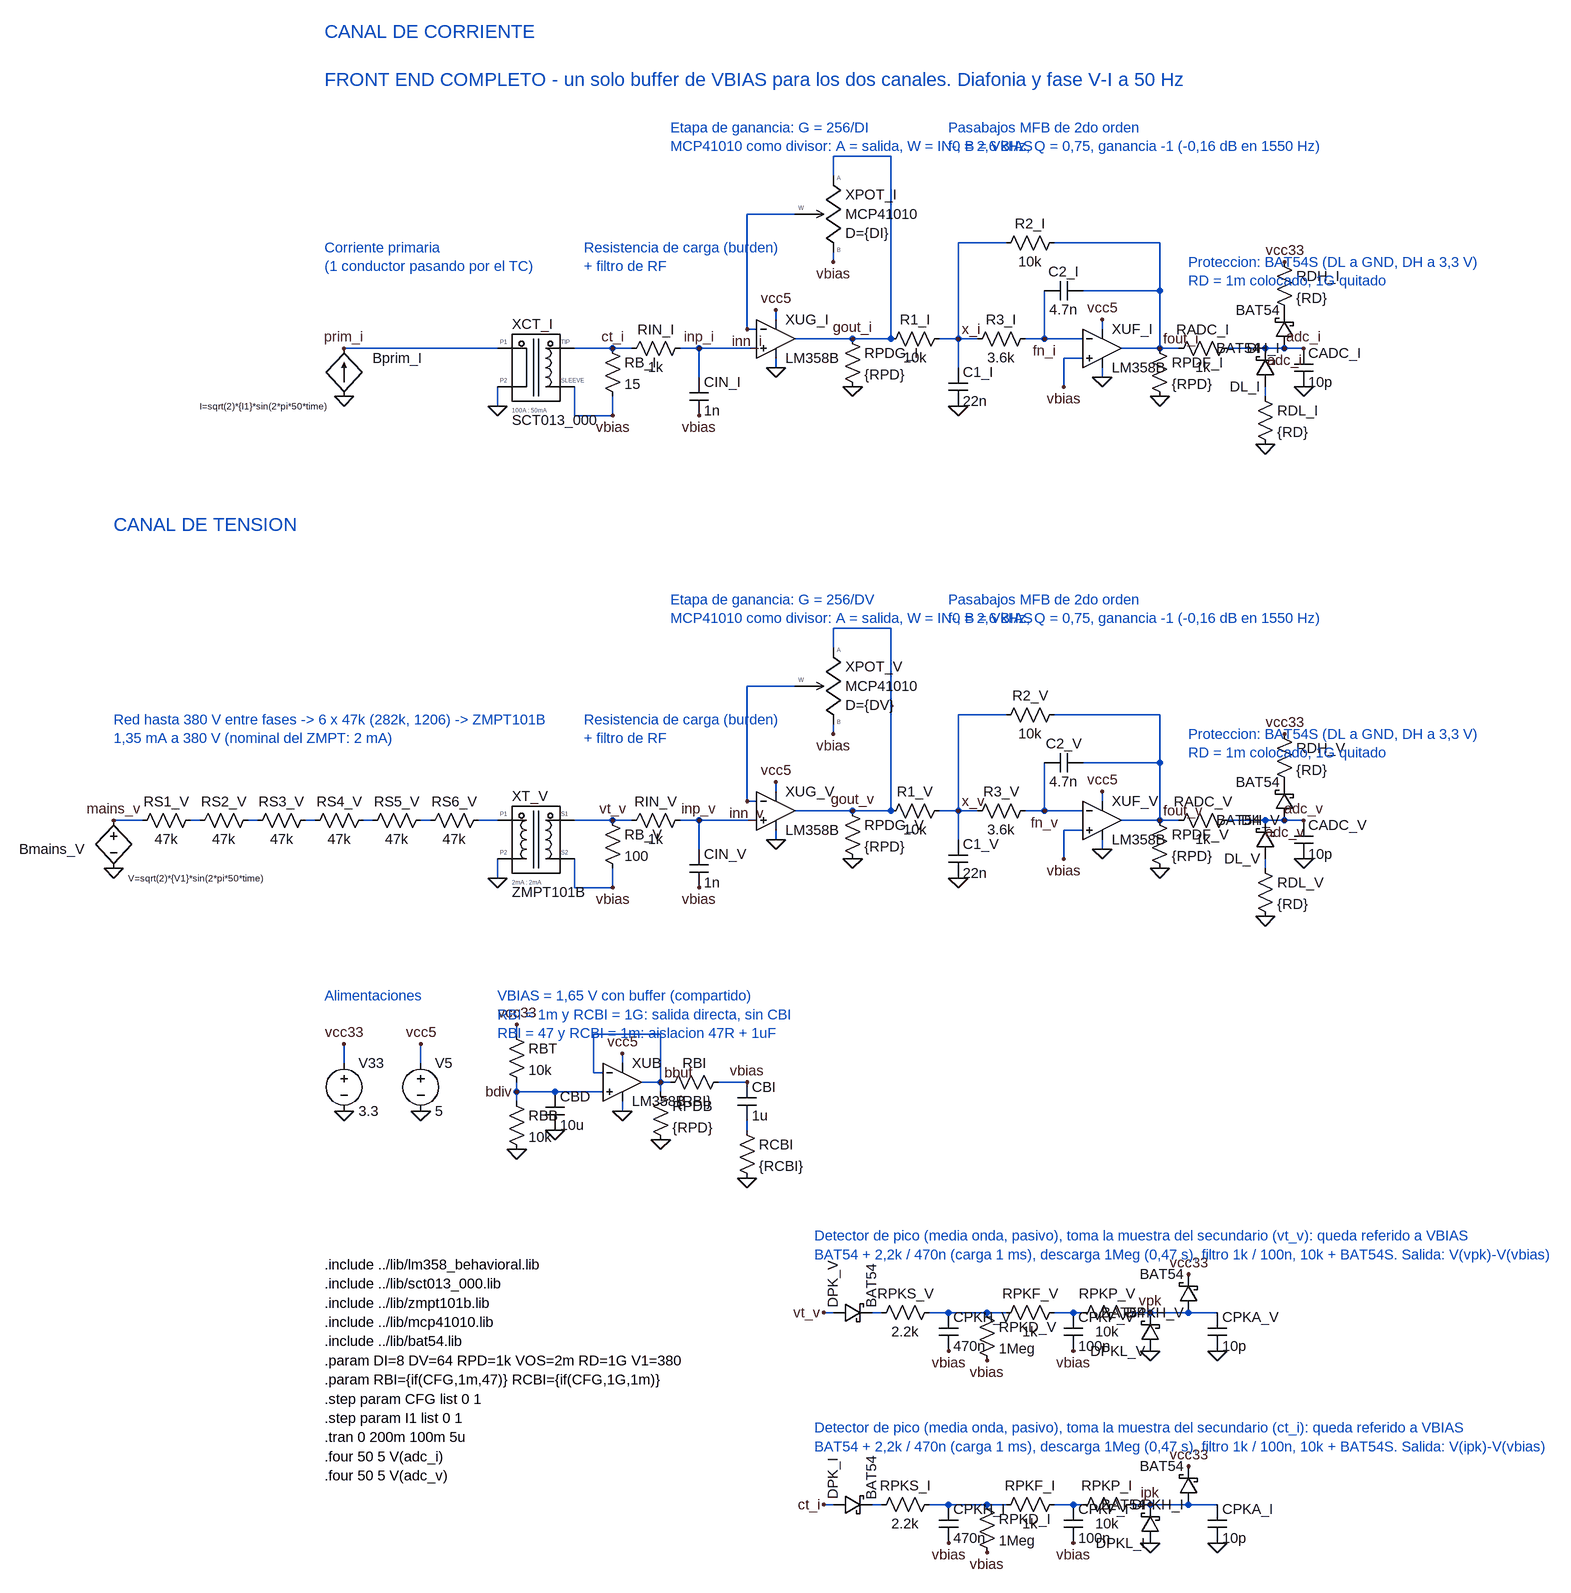
[diagram p0: schematic front_end_tran.asc]
front_end_tran.asc, the LTspice schematic file:
Version 4
SHEET 1 1880 1100
WIRE -960 128 -704 128
WIRE -704 192 -704 224
WIRE -576 128 -512 128
WIRE -576 192 -576 240
WIRE -576 240 -512 240
WIRE -512 240 -512 208
WIRE -512 128 -480 128
WIRE -400 128 -368 128
WIRE -368 128 -368 176
WIRE -368 128 -272 128
WIRE -240 80 -240 64
WIRE -240 144 -240 160
WIRE -208 -96 -288 -96
WIRE -288 -96 -288 96
WIRE -288 96 -272 96
WIRE -144 -32 -144 -16
WIRE -208 112 -112 112
WIRE -112 112 -48 112
WIRE -144 -160 -144 -192
WIRE -144 -192 -48 -192
WIRE -48 -192 -48 112
WIRE 32 112 64 112
WIRE 64 112 64 160
WIRE 64 112 96 112
WIRE 64 112 64 -48
WIRE 64 -48 144 -48
WIRE 176 112 208 112
WIRE 208 112 272 112
WIRE 208 112 208 32
WIRE 272 32 400 32
WIRE 224 -48 400 -48
WIRE 400 -48 400 32
WIRE 400 32 400 128
WIRE 336 128 400 128
WIRE 272 144 240 144
WIRE 240 144 240 192
WIRE 304 96 304 80
WIRE 304 160 304 176
WIRE 400 128 432 128
WIRE 512 128 576 128
WIRE 576 128 640 128
WIRE 576 192 576 208
WIRE -1344 1248 -1296 1248
WIRE -1216 1248 -1200 1248
WIRE -1120 1248 -1104 1248
WIRE -1024 1248 -1008 1248
WIRE -928 1248 -912 1248
WIRE -832 1248 -816 1248
WIRE -736 1248 -704 1248
WIRE -704 1312 -704 1344
WIRE -576 1248 -512 1248
WIRE -576 1312 -576 1360
WIRE -576 1360 -512 1360
WIRE -512 1360 -512 1328
WIRE -512 1248 -480 1248
WIRE -400 1248 -368 1248
WIRE -368 1248 -368 1296
WIRE -368 1248 -272 1248
WIRE -240 1200 -240 1184
WIRE -240 1264 -240 1280
WIRE -208 1024 -288 1024
WIRE -288 1024 -288 1216
WIRE -288 1216 -272 1216
WIRE -144 1088 -144 1104
WIRE -208 1232 -112 1232
WIRE -112 1232 -48 1232
WIRE -144 960 -144 928
WIRE -144 928 -48 928
WIRE -48 928 -48 1232
WIRE 32 1232 64 1232
WIRE 64 1232 64 1280
WIRE 64 1232 96 1232
WIRE 64 1232 64 1072
WIRE 64 1072 144 1072
WIRE 176 1232 208 1232
WIRE 208 1232 272 1232
WIRE 208 1232 208 1152
WIRE 272 1152 400 1152
WIRE 224 1072 400 1072
WIRE 400 1072 400 1152
WIRE 400 1152 400 1248
WIRE 336 1248 400 1248
WIRE 272 1264 240 1264
WIRE 240 1264 240 1312
WIRE 304 1216 304 1200
WIRE 304 1280 304 1296
WIRE 400 1248 432 1248
WIRE 512 1248 576 1248
WIRE 576 1248 640 1248
WIRE 576 1312 576 1328
WIRE -960 2064 -960 2032
WIRE -832 2064 -832 2032
WIRE -672 2016 -672 2000
WIRE -672 2096 -672 2112
WIRE -672 2112 -672 2128
WIRE -672 2112 -608 2112
WIRE -608 2112 -528 2112
WIRE -496 2064 -496 2048
WIRE -496 2128 -496 2144
WIRE -464 2096 -432 2096
WIRE -432 2096 -432 2016
WIRE -432 2016 -544 2016
WIRE -544 2016 -544 2080
WIRE -544 2080 -528 2080
WIRE -432 2096 -432 2112
WIRE -432 2096 -416 2096
WIRE -336 2096 -288 2096
WIRE -288 2160 -288 2176
WIRE -160 2480 -144 2480
WIRE -80 2480 -64 2480
WIRE 16 2480 48 2480
WIRE 48 2480 112 2480
WIRE 112 2480 144 2480
WIRE 224 2480 256 2480
WIRE 256 2480 272 2480
WIRE 352 2480 448 2480
WIRE 448 2480 496 2480
WIRE -160 2800 -144 2800
WIRE -80 2800 -64 2800
WIRE 16 2800 48 2800
WIRE 48 2800 112 2800
WIRE 112 2800 144 2800
WIRE 224 2800 256 2800
WIRE 256 2800 272 2800
WIRE 352 2800 448 2800
WIRE 448 2800 496 2800
FLAG -960 208 0
FLAG -960 128 prim_i
FLAG -704 224 0
FLAG -512 240 vbias
FLAG -512 128 ct_i
FLAG -368 240 vbias
FLAG -368 128 inp_i
FLAG -240 64 vcc5
FLAG -240 160 0
FLAG -288 96 inn_i
FLAG -144 -16 vbias
FLAG -112 192 0
FLAG -112 112 gout_i
FLAG 64 224 0
FLAG 64 112 x_i
FLAG 208 112 fn_i
FLAG 240 192 vbias
FLAG 304 80 vcc5
FLAG 304 176 0
FLAG 400 208 0
FLAG 400 128 fout_i
FLAG 576 288 0
FLAG 640 192 0
FLAG 640 128 adc_i
FLAG -1344 1328 0
FLAG -1344 1248 mains_v
FLAG -704 1344 0
FLAG -512 1360 vbias
FLAG -512 1248 vt_v
FLAG -368 1360 vbias
FLAG -368 1248 inp_v
FLAG -240 1184 vcc5
FLAG -240 1280 0
FLAG -288 1216 inn_v
FLAG -144 1104 vbias
FLAG -112 1312 0
FLAG -112 1232 gout_v
FLAG 64 1344 0
FLAG 64 1232 x_v
FLAG 208 1232 fn_v
FLAG 240 1312 vbias
FLAG 304 1200 vcc5
FLAG 304 1296 0
FLAG 400 1328 0
FLAG 400 1248 fout_v
FLAG 576 1408 0
FLAG 640 1312 0
FLAG 640 1248 adc_v
FLAG -960 2032 vcc33
FLAG -960 2144 0
FLAG -832 2032 vcc5
FLAG -832 2144 0
FLAG -672 2000 vcc33
FLAG -672 2208 0
FLAG -608 2176 0
FLAG -672 2112 bdiv
FLAG -496 2048 vcc5
FLAG -496 2144 0
FLAG -432 2192 0
FLAG -432 2096 bbuf
FLAG -288 2256 0
FLAG -288 2096 vbias
FLAG 608 128 adc_i
FLAG 608 -16 vcc33
FLAG 608 1248 adc_v
FLAG 608 1104 vcc33
FLAG -160 2480 vt_v
FLAG 48 2544 vbias
FLAG 112 2560 vbias
FLAG 256 2544 vbias
FLAG 384 2480 vpk
FLAG 384 2544 0
FLAG 448 2416 vcc33
FLAG 496 2544 0
FLAG -160 2800 ct_i
FLAG 48 2864 vbias
FLAG 112 2880 vbias
FLAG 256 2864 vbias
FLAG 384 2800 ipk
FLAG 384 2864 0
FLAG 448 2736 vcc33
FLAG 496 2864 0
SYMBOL bi -960 208 R180
WINDOW 0 -48 64 Right 2
WINDOW 3 24 -16 Left 1
SYMATTR InstName Bprim_I
SYMATTR Value I=sqrt(2)*{I1}*sin(2*pi*50*time)
SYMBOL SCT013_000 -640 128 R0
SYMATTR InstName XCT_I
SYMATTR Value SCT013_000
SYMBOL res -528 112 R0
SYMATTR InstName RB_I
SYMATTR Value 15
SYMBOL res -384 112 R90
WINDOW 0 0 56 VBottom 2
WINDOW 3 32 56 VTop 2
SYMATTR InstName RIN_I
SYMATTR Value 1k
SYMBOL cap -384 176 R0
SYMATTR InstName CIN_I
SYMATTR Value 1n
SYMBOL OpAmps\\opamp2 -240 48 R0
SYMATTR InstName XUG_I
SYMATTR Value LM358B
SYMATTR SpiceLine VOS={VOS}
SYMBOL MCP41010 -144 -160 R0
SYMATTR InstName XPOT_I
SYMATTR Value MCP41010
SYMATTR SpiceLine D={DI}
SYMBOL res -128 96 R0
SYMATTR InstName RPDG_I
SYMATTR Value {RPD}
SYMBOL res 48 96 R90
WINDOW 0 0 56 VBottom 2
WINDOW 3 32 56 VTop 2
SYMATTR InstName R1_I
SYMATTR Value 10k
SYMBOL cap 48 160 R0
SYMATTR InstName C1_I
SYMATTR Value 22n
SYMBOL res 192 96 R90
WINDOW 0 0 56 VBottom 2
WINDOW 3 32 56 VTop 2
SYMATTR InstName R3_I
SYMATTR Value 3.6k
SYMBOL res 240 -64 R90
WINDOW 0 0 56 VBottom 2
WINDOW 3 32 56 VTop 2
SYMATTR InstName R2_I
SYMATTR Value 10k
SYMBOL OpAmps\\opamp2 304 64 R0
SYMATTR InstName XUF_I
SYMATTR Value LM358B
SYMBOL cap 272 16 R90
WINDOW 0 0 32 VBottom 2
WINDOW 3 32 32 VTop 2
SYMATTR InstName C2_I
SYMATTR Value 4.7n
SYMBOL res 384 112 R0
SYMATTR InstName RPDF_I
SYMATTR Value {RPD}
SYMBOL res 528 112 R90
WINDOW 0 0 56 VBottom 2
WINDOW 3 32 56 VTop 2
SYMATTR InstName RADC_I
SYMATTR Value 1k
SYMBOL schottky 592 192 R180
SYMATTR InstName DL_I
SYMATTR Value BAT54
SYMBOL res 560 192 R0
SYMATTR InstName RDL_I
SYMATTR Value {RD}
SYMBOL cap 624 128 R0
SYMATTR InstName CADC_I
SYMATTR Value 10p
SYMBOL bv -1344 1232 R0
WINDOW 0 -48 64 Right 2
WINDOW 3 24 112 Left 1
SYMATTR InstName Bmains_V
SYMATTR Value V=sqrt(2)*{V1}*sin(2*pi*50*time)
SYMBOL res -1200 1232 R90
WINDOW 0 0 56 VBottom 2
WINDOW 3 32 56 VTop 2
SYMATTR InstName RS1_V
SYMATTR Value 47k
SYMBOL res -1104 1232 R90
WINDOW 0 0 56 VBottom 2
WINDOW 3 32 56 VTop 2
SYMATTR InstName RS2_V
SYMATTR Value 47k
SYMBOL res -1008 1232 R90
WINDOW 0 0 56 VBottom 2
WINDOW 3 32 56 VTop 2
SYMATTR InstName RS3_V
SYMATTR Value 47k
SYMBOL res -912 1232 R90
WINDOW 0 0 56 VBottom 2
WINDOW 3 32 56 VTop 2
SYMATTR InstName RS4_V
SYMATTR Value 47k
SYMBOL res -816 1232 R90
WINDOW 0 0 56 VBottom 2
WINDOW 3 32 56 VTop 2
SYMATTR InstName RS5_V
SYMATTR Value 47k
SYMBOL res -720 1232 R90
WINDOW 0 0 56 VBottom 2
WINDOW 3 32 56 VTop 2
SYMATTR InstName RS6_V
SYMATTR Value 47k
SYMBOL ZMPT101B -640 1248 R0
SYMATTR InstName XT_V
SYMATTR Value ZMPT101B
SYMBOL res -528 1232 R0
SYMATTR InstName RB_V
SYMATTR Value 100
SYMBOL res -384 1232 R90
WINDOW 0 0 56 VBottom 2
WINDOW 3 32 56 VTop 2
SYMATTR InstName RIN_V
SYMATTR Value 1k
SYMBOL cap -384 1296 R0
SYMATTR InstName CIN_V
SYMATTR Value 1n
SYMBOL OpAmps\\opamp2 -240 1168 R0
SYMATTR InstName XUG_V
SYMATTR Value LM358B
SYMATTR SpiceLine VOS={VOS}
SYMBOL res -128 1216 R0
SYMATTR InstName RPDG_V
SYMATTR Value {RPD}
SYMBOL res 48 1216 R90
WINDOW 0 0 56 VBottom 2
WINDOW 3 32 56 VTop 2
SYMATTR InstName R1_V
SYMATTR Value 10k
SYMBOL cap 48 1280 R0
SYMATTR InstName C1_V
SYMATTR Value 22n
SYMBOL res 192 1216 R90
WINDOW 0 0 56 VBottom 2
WINDOW 3 32 56 VTop 2
SYMATTR InstName R3_V
SYMATTR Value 3.6k
SYMBOL res 240 1056 R90
WINDOW 0 0 56 VBottom 2
WINDOW 3 32 56 VTop 2
SYMATTR InstName R2_V
SYMATTR Value 10k
SYMBOL OpAmps\\opamp2 304 1184 R0
SYMATTR InstName XUF_V
SYMATTR Value LM358B
SYMBOL cap 272 1136 R90
WINDOW 0 0 32 VBottom 2
WINDOW 3 32 32 VTop 2
SYMATTR InstName C2_V
SYMATTR Value 4.7n
SYMBOL res 384 1232 R0
SYMATTR InstName RPDF_V
SYMATTR Value {RPD}
SYMBOL res 528 1232 R90
WINDOW 0 0 56 VBottom 2
WINDOW 3 32 56 VTop 2
SYMATTR InstName RADC_V
SYMATTR Value 1k
SYMBOL schottky 592 1312 R180
SYMATTR InstName DL_V
SYMATTR Value BAT54
SYMBOL res 560 1312 R0
SYMATTR InstName RDL_V
SYMATTR Value {RD}
SYMBOL cap 624 1248 R0
SYMATTR InstName CADC_V
SYMATTR Value 10p
SYMBOL voltage -960 2048 R0
SYMATTR InstName V33
SYMATTR Value 3.3
SYMBOL voltage -832 2048 R0
SYMATTR InstName V5
SYMATTR Value 5
SYMBOL res -688 2000 R0
SYMATTR InstName RBT
SYMATTR Value 10k
SYMBOL res -688 2112 R0
SYMATTR InstName RBB
SYMATTR Value 10k
SYMBOL cap -624 2112 R0
SYMATTR InstName CBD
SYMATTR Value 10u
SYMBOL OpAmps\\opamp2 -496 2032 R0
SYMATTR InstName XUB
SYMATTR Value LM358B
SYMBOL res -448 2096 R0
SYMATTR InstName RPDB
SYMATTR Value {RPD}
SYMBOL res -320 2080 R90
WINDOW 0 0 56 VBottom 2
WINDOW 3 32 56 VTop 2
SYMATTR InstName RBI
SYMATTR Value {RBI}
SYMBOL cap -304 2096 R0
SYMATTR InstName CBI
SYMATTR Value 1u
SYMBOL res -304 2160 R0
SYMATTR InstName RCBI
SYMATTR Value {RCBI}
SYMBOL schottky 624 128 R180
SYMATTR InstName DH_I
SYMATTR Value BAT54
SYMBOL res 592 -32 R0
SYMATTR InstName RDH_I
SYMATTR Value {RD}
SYMBOL schottky 624 1248 R180
SYMATTR InstName DH_V
SYMATTR Value BAT54
SYMBOL res 592 1088 R0
SYMATTR InstName RDH_V
SYMATTR Value {RD}
SYMBOL schottky -144 2496 R270
SYMATTR InstName DPK_V
SYMATTR Value BAT54
SYMBOL res 32 2464 R90
WINDOW 0 0 56 VBottom 2
WINDOW 3 32 56 VTop 2
SYMATTR InstName RPKS_V
SYMATTR Value 2.2k
SYMBOL cap 32 2480 R0
SYMATTR InstName CPKH_V
SYMATTR Value 470n
SYMBOL res 96 2464 R0
SYMATTR InstName RPKD_V
SYMATTR Value 1Meg
SYMBOL res 240 2464 R90
WINDOW 0 0 56 VBottom 2
WINDOW 3 32 56 VTop 2
SYMATTR InstName RPKF_V
SYMATTR Value 1k
SYMBOL cap 240 2480 R0
SYMATTR InstName CPKF_V
SYMATTR Value 100n
SYMBOL res 368 2464 R90
WINDOW 0 0 56 VBottom 2
WINDOW 3 32 56 VTop 2
SYMATTR InstName RPKP_V
SYMATTR Value 10k
SYMBOL schottky 400 2544 R180
SYMATTR InstName DPKL_V
SYMATTR Value BAT54
SYMBOL schottky 464 2480 R180
SYMATTR InstName DPKH_V
SYMATTR Value BAT54
SYMBOL cap 480 2480 R0
SYMATTR InstName CPKA_V
SYMATTR Value 10p
SYMBOL schottky -144 2816 R270
SYMATTR InstName DPK_I
SYMATTR Value BAT54
SYMBOL res 32 2784 R90
WINDOW 0 0 56 VBottom 2
WINDOW 3 32 56 VTop 2
SYMATTR InstName RPKS_I
SYMATTR Value 2.2k
SYMBOL cap 32 2800 R0
SYMATTR InstName CPKH_I
SYMATTR Value 470n
SYMBOL res 96 2784 R0
SYMATTR InstName RPKD_I
SYMATTR Value 1Meg
SYMBOL res 240 2784 R90
WINDOW 0 0 56 VBottom 2
WINDOW 3 32 56 VTop 2
SYMATTR InstName RPKF_I
SYMATTR Value 1k
SYMBOL cap 240 2800 R0
SYMATTR InstName CPKF_I
SYMATTR Value 100n
SYMBOL res 368 2784 R90
WINDOW 0 0 56 VBottom 2
WINDOW 3 32 56 VTop 2
SYMATTR InstName RPKP_I
SYMATTR Value 10k
SYMBOL schottky 400 2864 R180
SYMATTR InstName DPKL_I
SYMATTR Value BAT54
SYMBOL schottky 464 2800 R180
SYMATTR InstName DPKH_I
SYMATTR Value BAT54
SYMBOL cap 480 2800 R0
SYMATTR InstName CPKA_I
SYMATTR Value 10p
SYMBOL MCP41010 -144 960 R0
SYMATTR InstName XPOT_V
SYMATTR Value MCP41010
SYMATTR SpiceLine D={DV}
TEXT -992 -40 Left 2 ;Corriente primaria\n(1 conductor pasando por el TC)
TEXT -560 -40 Left 2 ;Resistencia de carga (burden)\n+ filtro de RF
TEXT -416 -240 Left 2 ;Etapa de ganancia: G = 256/DI\nMCP41010 como divisor: A = salida, W = IN-, B = VBIAS
TEXT 48 -240 Left 2 ;Pasabajos MFB de 2do orden\nf0 = 2,6 kHz, Q = 0,75, ganancia -1 (-0,16 dB en 1550 Hz)
TEXT 448 -16 Left 2 ;Proteccion: BAT54S (DL a GND, DH a 3,3 V)\nRD = 1m colocado, 1G quitado
TEXT -1344 1080 Left 2 ;Red hasta 380 V entre fases -> 6 x 47k (282k, 1206) -> ZMPT101B\n1,35 mA a 380 V (nominal del ZMPT: 2 mA)
TEXT -560 1080 Left 2 ;Resistencia de carga (burden)\n+ filtro de RF
TEXT -416 880 Left 2 ;Etapa de ganancia: G = 256/DV\nMCP41010 como divisor: A = salida, W = IN-, B = VBIAS
TEXT 48 880 Left 2 ;Pasabajos MFB de 2do orden\nf0 = 2,6 kHz, Q = 0,75, ganancia -1 (-0,16 dB en 1550 Hz)
TEXT 448 1104 Left 2 ;Proteccion: BAT54S (DL a GND, DH a 3,3 V)\nRD = 1m colocado, 1G quitado
TEXT -992 1952 Left 2 ;Alimentaciones
TEXT -704 1952 Left 2 ;VBIAS = 1,65 V con buffer (compartido)\nRBI = 1m y RCBI = 1G: salida directa, sin CBI\nRBI = 47 y RCBI = 1m: aislacion 47R + 1uF
TEXT -1344 720 Left 3 ;CANAL DE TENSION
TEXT -992 -400 Left 3 ;CANAL DE CORRIENTE
TEXT -992 -320 Left 3 ;FRONT END COMPLETO - un solo buffer de VBIAS para los dos canales. Diafonia y fase V-I a 50 Hz
TEXT -992 2400 Left 2 !.include ../lib/lm358_behavioral.lib
TEXT -992 2432 Left 2 !.include ../lib/sct013_000.lib
TEXT -992 2464 Left 2 !.include ../lib/zmpt101b.lib
TEXT -992 2496 Left 2 !.include ../lib/mcp41010.lib
TEXT -992 2528 Left 2 !.include ../lib/bat54.lib
TEXT -992 2560 Left 2 !.param DI=8 DV=64 RPD=1k VOS=2m RD=1G V1=380
TEXT -992 2592 Left 2 !.param RBI={if(CFG,1m,47)} RCBI={if(CFG,1G,1m)}
TEXT -992 2624 Left 2 !.step param CFG list 0 1
TEXT -992 2656 Left 2 !.step param I1 list 0 1
TEXT -992 2688 Left 2 !.tran 0 200m 100m 5u
TEXT -992 2720 Left 2 !.four 50 5 V(adc_i)
TEXT -992 2752 Left 2 !.four 50 5 V(adc_v)
TEXT -176 2352 Left 2 ;Detector de pico (media onda, pasivo), toma la muestra del secundario (vt_v): queda referido a VBIAS\nBAT54 + 2,2k / 470n (carga 1 ms), descarga 1Meg (0,47 s), filtro 1k / 100n, 10k + BAT54S. Salida: V(vpk)-V(vbias)
TEXT -176 2672 Left 2 ;Detector de pico (media onda, pasivo), toma la muestra del secundario (ct_i): queda referido a VBIAS\nBAT54 + 2,2k / 470n (carga 1 ms), descarga 1Meg (0,47 s), filtro 1k / 100n, 10k + BAT54S. Salida: V(ipk)-V(vbias)

The netlist it stands for:
* front_end_tran.asc
Bprim_I 0 prim_i I=sqrt(2)*{I1}*sin(2*pi*50*time)
XXCT_I prim_i 0 ct_i vbias SCT013_000  ; pins P1 P2 TIP SLEEVE
RB_I ct_i vbias 15
RIN_I inp_i ct_i 1k
CIN_I inp_i vbias 1n
XXUG_I inp_i inn_i vcc5 0 gout_i LM358B VOS={VOS}  ; pins In+ In- V+ V- OUT
XXPOT_I gout_i inn_i vbias MCP41010 D={DI}  ; pins A W B
RPDG_I gout_i 0 {RPD}
R1_I x_i gout_i 10k
C1_I x_i 0 22n
R3_I fn_i x_i 3.6k
R2_I fout_i x_i 10k
XXUF_I vbias fn_i vcc5 0 fout_i LM358B  ; pins In+ In- V+ V- OUT
C2_I fout_i fn_i 4.7n
RPDF_I fout_i 0 {RPD}
RADC_I adc_i fout_i 1k
DL_I N001 adc_i BAT54
RDL_I N001 0 {RD}
CADC_I adc_i 0 10p
Bmains_V mains_v 0 V=sqrt(2)*{V1}*sin(2*pi*50*time)
RS1_V N002 mains_v 47k
RS2_V N003 N002 47k
RS3_V N004 N003 47k
RS4_V N005 N004 47k
RS5_V N006 N005 47k
RS6_V N007 N006 47k
XXT_V N007 0 vt_v vbias ZMPT101B  ; pins P1 P2 S1 S2
RB_V vt_v vbias 100
RIN_V inp_v vt_v 1k
CIN_V inp_v vbias 1n
XXUG_V inp_v inn_v vcc5 0 gout_v LM358B VOS={VOS}  ; pins In+ In- V+ V- OUT
RPDG_V gout_v 0 {RPD}
R1_V x_v gout_v 10k
C1_V x_v 0 22n
R3_V fn_v x_v 3.6k
R2_V fout_v x_v 10k
XXUF_V vbias fn_v vcc5 0 fout_v LM358B  ; pins In+ In- V+ V- OUT
C2_V fout_v fn_v 4.7n
RPDF_V fout_v 0 {RPD}
RADC_V adc_v fout_v 1k
DL_V N008 adc_v BAT54
RDL_V N008 0 {RD}
CADC_V adc_v 0 10p
V33 vcc33 0 3.3
V5 vcc5 0 5
RBT vcc33 bdiv 10k
RBB bdiv 0 10k
CBD bdiv 0 10u
XXUB bdiv bbuf vcc5 0 bbuf LM358B  ; pins In+ In- V+ V- OUT
RPDB bbuf 0 {RPD}
RBI vbias bbuf {RBI}
CBI vbias N009 1u
RCBI N009 0 {RCBI}
DH_I adc_i P001 BAT54
RDH_I vcc33 P001 {RD}
DH_V adc_v P002 BAT54
RDH_V vcc33 P002 {RD}
DPK_V vt_v N010 BAT54
RPKS_V N011 N010 2.2k
CPKH_V N011 vbias 470n
RPKD_V N011 vbias 1Meg
RPKF_V N012 N011 1k
CPKF_V N012 vbias 100n
RPKP_V vpk N012 10k
DPKL_V 0 vpk BAT54
DPKH_V vpk vcc33 BAT54
CPKA_V vpk 0 10p
DPK_I ct_i N013 BAT54
RPKS_I N014 N013 2.2k
CPKH_I N014 vbias 470n
RPKD_I N014 vbias 1Meg
RPKF_I N015 N014 1k
CPKF_I N015 vbias 100n
RPKP_I ipk N015 10k
DPKL_I 0 ipk BAT54
DPKH_I ipk vcc33 BAT54
CPKA_I ipk 0 10p
XXPOT_V gout_v inn_v vbias MCP41010 D={DV}  ; pins A W B
.model D D
.lib standard.dio
* Corriente primaria
* (1 conductor pasando por el TC)
* Resistencia de carga (burden)
* + filtro de RF
* Etapa de ganancia: G = 256/DI
* MCP41010 como divisor: A = salida, W = IN-, B = VBIAS
* Pasabajos MFB de 2do orden
* f0 = 2,6 kHz, Q = 0,75, ganancia -1 (-0,16 dB en 1550 Hz)
* Proteccion: BAT54S (DL a GND, DH a 3,3 V)
* RD = 1m colocado, 1G quitado
* Red hasta 380 V entre fases -> 6 x 47k (282k, 1206) -> ZMPT101B
* 1,35 mA a 380 V (nominal del ZMPT: 2 mA)
* Resistencia de carga (burden)
* + filtro de RF
* Etapa de ganancia: G = 256/DV
* MCP41010 como divisor: A = salida, W = IN-, B = VBIAS
* Pasabajos MFB de 2do orden
* f0 = 2,6 kHz, Q = 0,75, ganancia -1 (-0,16 dB en 1550 Hz)
* Proteccion: BAT54S (DL a GND, DH a 3,3 V)
* RD = 1m colocado, 1G quitado
* Alimentaciones
* VBIAS = 1,65 V con buffer (compartido)
* RBI = 1m y RCBI = 1G: salida directa, sin CBI
* RBI = 47 y RCBI = 1m: aislacion 47R + 1uF
* CANAL DE TENSION
* CANAL DE CORRIENTE
* FRONT END COMPLETO - un solo buffer de VBIAS para los dos canales. Diafonia y fase V-I a 50 Hz
.include ../lib/lm358_behavioral.lib
.include ../lib/sct013_000.lib
.include ../lib/zmpt101b.lib
.include ../lib/mcp41010.lib
.include ../lib/bat54.lib
.param DI=8 DV=64 RPD=1k VOS=2m RD=1G V1=380
.param RBI={if(CFG,1m,47)} RCBI={if(CFG,1G,1m)}
.step param CFG list 0 1
.step param I1 list 0 1
.tran 0 200m 100m 5u
.four 50 5 V(adc_i)
.four 50 5 V(adc_v)
* Detector de pico (media onda, pasivo), toma la muestra del secundario (vt_v): queda referido a VBIAS
* BAT54 + 2,2k / 470n (carga 1 ms), descarga 1Meg (0,47 s), filtro 1k / 100n, 10k + BAT54S. Salida: V(vpk)-V(vbias)
* Detector de pico (media onda, pasivo), toma la muestra del secundario (ct_i): queda referido a VBIAS
* BAT54 + 2,2k / 470n (carga 1 ms), descarga 1Meg (0,47 s), filtro 1k / 100n, 10k + BAT54S. Salida: V(ipk)-V(vbias)
.backanno
.end